# Altium schematic sheet 01_Power_Protection.SchDoc: POWER
size A4; SheetNumber: 2; SheetTotal: 12
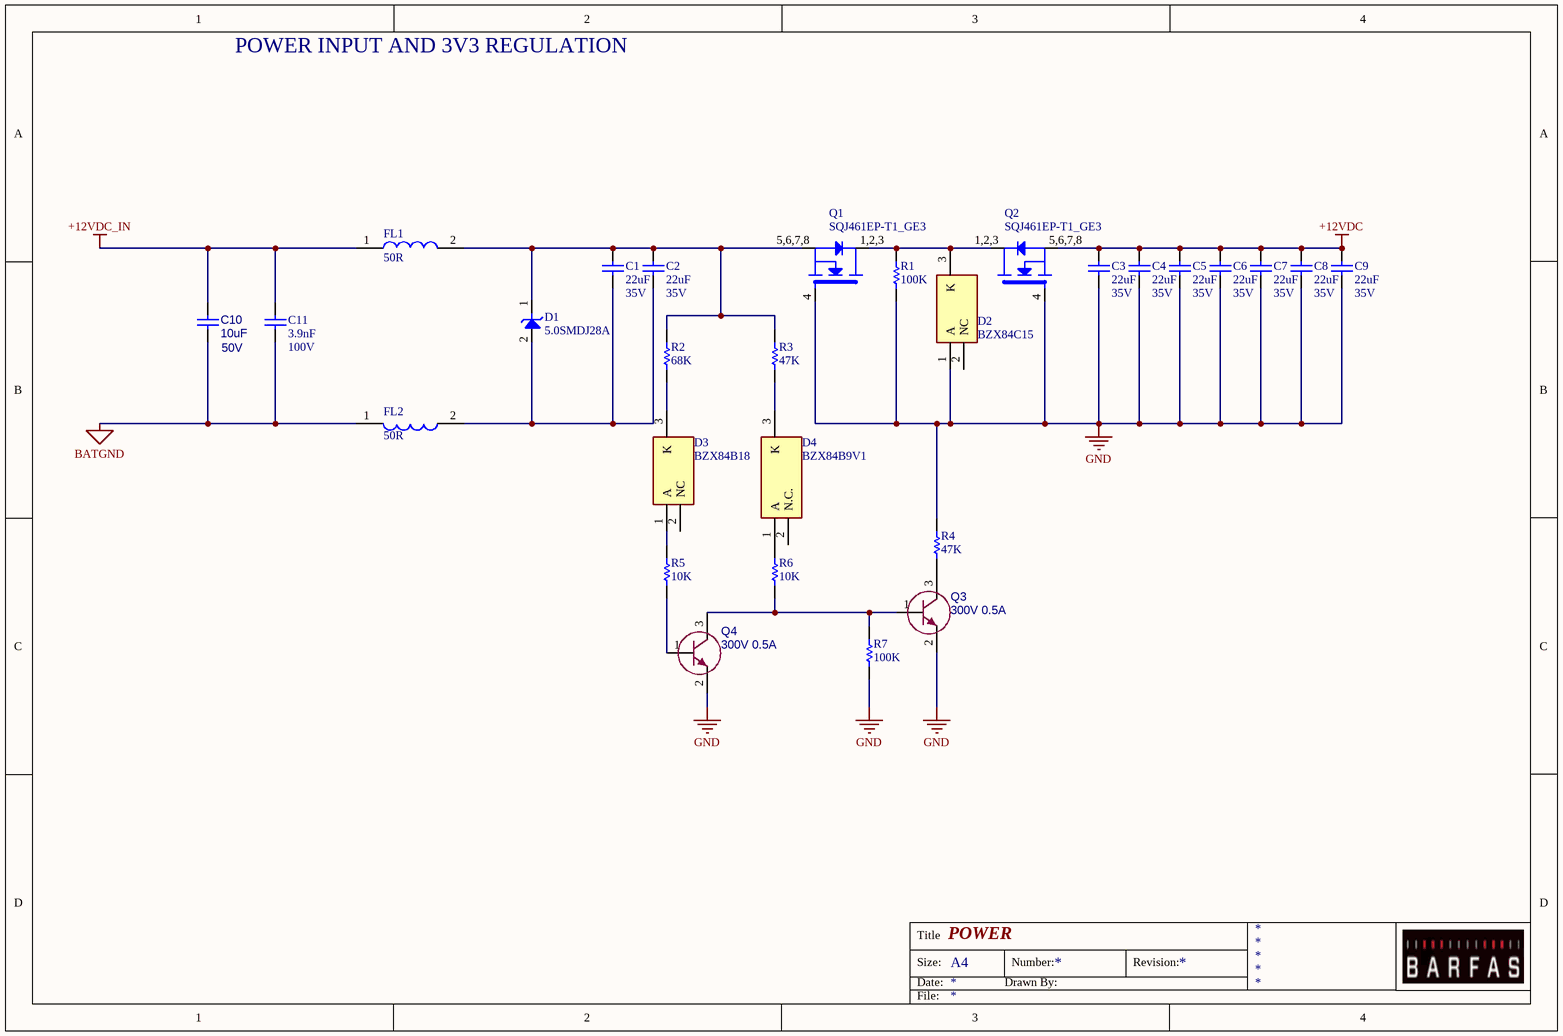
[diagram p0: 01_Power_Protection.SchDoc]

## Parts
C1  value 22uF  Voltage: 35V  [CAP_0805]  (hidden comment: GMC21X5R226M35NT)
C2  value 22uF  Voltage: 35V  [CAP_0805]  (hidden comment: GMC21X5R226M35NT)
C3  value 22uF  Voltage: 35V  [CAP_0805]  (hidden comment: GMC21X5R226M35NT)
C4  value 22uF  Voltage: 35V  [CAP_0805]  (hidden comment: GMC21X5R226M35NT)
C5  value 22uF  Voltage: 35V  [CAP_0805]  (hidden comment: GMC21X5R226M35NT)
C6  value 22uF  Voltage: 35V  [CAP_0805]  (hidden comment: GMC21X5R226M35NT)
C7  value 22uF  Voltage: 35V  [CAP_0805]  (hidden comment: GMC21X5R226M35NT)
C8  value 22uF  Voltage: 35V  [CAP_0805]  (hidden comment: GMC21X5R226M35NT)
C9  value 22uF  Voltage: 35V  [CAP_0805]  (hidden comment: GMC21X5R226M35NT)
C10  value 10uF  Voltage: 50V  [CAP_1206]  (hidden comment: CL31B106KBHNNNE)
C11  value 3.9nF  Voltage: 100V  [CAP_0603]  (hidden comment: AC0603KRX7R0BB392)
D1  5.0SMDJ28A  [SMCJ58A]
D2  BZX84C15  [SOT95P240X120-3N]
D3  BZX84B18  [SOT95P240X110-3N]
D4  BZX84B9V1  [SOT95P240X110-3N]
FL1  value 50R  [BLM31AJ601SH1K]  (hidden comment: BLM31SN500SZ1L)
FL2  value 50R  [BLM31AJ601SH1K]  (hidden comment: BLM31SN500SZ1L)
Q1  SQJ461EP-T1_GE3  [SOT323]
Q2  SQJ461EP-T1_GE3  [SOT323]
Q3  value 300V 0.5A  [SOT-23-3]  (hidden comment: MMBTA42_R1_00001)
Q4  value 300V 0.5A  [SOT-23-3]  (hidden comment: MMBTA42_R1_00001)
R1  value 100K  [RES_0402]  (hidden comment: 0402WGF1003TCE)
R2  value 68K  [RES_0402]  (hidden comment: 0402WGF6802TCE)
R3  value 47K  [RES_0603]  (hidden comment: 0603SAF4702T5E)
R4  value 47K  [RES_0603]  (hidden comment: 0603SAF4702T5E)
R5  value 10K  [RES_0402]  (hidden comment: RC0402JR-0710KL)
R6  value 10K  [RES_0402]  (hidden comment: RC0402JR-0710KL)
R7  value 100K  [RES_0402]  (hidden comment: 0402WGF1003TCE)

## Nets
+12VDC: C3.1 C4.1 C5.1 C6.1 C7.1 C8.1 C9.1 Q2.5,6,7,8(S)
+12VDC_IN: C10.1 C11.2 FL1.1
BATGND: C10.2 C11.1 FL2.1
GND: C3.2 C4.2 C5.2 C6.2 C7.2 C8.2 C9.2 D2.1(A) Q1.4(G) Q2.4(G) Q3.2(E) Q4.2(E) R1.1 R4.2 R7.1
NetC1_1: C1.1 C2.1 D1.1 FL1.2 Q1.5,6,7,8(S) R2.2 R3.2
NetC1_2: C1.2 C2.2 D1.2 FL2.2
NetD2_3: D2.3(K) Q1.1,2,3(D) Q2.1,2,3(D) R1.2
NetD3_1: D3.1(A) R5.2
NetD3_3: D3.3(K) R2.1
NetD4_1: D4.1(A) R6.2
NetD4_3: D4.3(K) R3.1
NetQ3_1: Q3.1(B) Q4.3(C) R6.1 R7.2
NetQ3_3: Q3.3(C) R4.1
NetQ4_1: Q4.1(B) R5.1

Not connected (* = marked no-connect by the designer): D2 2(NC); D3 2(NC); D4 2(N.C.)

## Notes on the sheet
- POWER INPUT AND 3V3 REGULATION
- Title
- Size:
- Date:
- A4
- Drawn By:
- Number:
- Revision:
- File:

## Library data of the parts
C1-C9 = C01758: 22 µF ±20% 35V Ceramic Capacitor X5R 0805 (2012 Metric); Manufacturer: Cal-Chip Electronics, Inc.; Manufacturer Part Number: GMC21X5R226M35NT
C10 = CL31A106KBHNNNE: MLCC (3216) 1206 10uF 50VDC ±10% X7R; Manufacturer: SAMSUNG; Package: 1206 (3216 Metric); Manufacturer Part Number: CL31B106KBHNNNE
C11 = C01763: MLCC (1608) 0603 3.9nF 100VDC ±10% X7R AEC-Q200; Manufacturer: YAGEO; Manufacturer Part Number: AC0603KRX7R0BB392
D1 = 5.0SMDJ28A: 45.4V Clamp 110A Ipp Tvs Diode Surface Mount DO-214AB (SMC); Manufacturer: Bourns Inc.; Datasheet Link: https://www.diodes.com/part/view/SMCJ58A; Height: 2.5mm; Manufacturer Part Number: 5.0SMDJ28A; Mouser Part Number: N/A; Mouser Price/Stock: https://www.mouser.co.uk/ProductDetail/Diodes-Incorporated/SMCJ58A?qs=evjyFmOIEsnFZCuxUMyzBg%3D%3D
D2 = BZX84C15: Zener Diode; Manufacturer: Diotec; Manufacturer Part Number: BZX84C15
D3 = BZX84B18: Zener Diode; Manufacturer: PANJIT; Manufacturer Part Number: BZX84B18
D4 = BZX84B9V1: Zener Diode; Manufacturer: PANJIT; Manufacturer Part Number: BZX84B9V1
FL1 FL2 = BLM31SN500SZ1L: Ferrite Bead, 50 ohm @ 100 MHz, 12 A, 1206; Manufacturer: Murata Electronics; Manufacturer Part Number: BLM31SN500SZ1L
Q1 Q2 = SQJ461EP-T1_GE3: P-Channel 60 V 30A (Tc) 83W (Tc) Surface Mount PowerPAK® SO-8; Manufacturer: Vishay Siliconix; Value: *; Supplier 1: OZDISAN; Manufacturer Part Number: SQJ461EP-T1_GE3
Q3 Q4 = MMBTA42_R1_00001: TRANSISTOR DIS.500mA 300V NPN SOT23 GEN. SMT; Manufacturer: PANJIT; Package: SOT23; Supplier Part Number 1: 3757-MMBTA42_R1_00001CT-ND; Supplier Part Number 2: *; Supplier Part Number 3: MMBTA42_R1_00001; Supplier 1: DIGIKEY; Supplier 2: MOUSER; Supplier 3: OZDISAN; Manufacturer Part Number: MMBTA42_R1_00001
R1 R7 = R03000: RES.(1005) 0402 100K Ohms 1% 1/16W 100PPM; Manufacturer: ROYALOHM; Manufacturer Part Number: 0402WGF1003TCE
R2 = R03000: RES.(1005) 0402 68K Ohms 1% 1/16W 100PPM; Manufacturer: ROYALOHM; Manufacturer Part Number: 0402WGF6802TCE
R3 R4 = 0603SAF4702T5E: RES.(1608) 0603 47K Ohms 1% 1/10W-S 100PPM; Manufacturer: ROYALOHM; Supplier 1: Ozdisan; Manufacturer Part Number: 0603SAF4702T5E
R5 R6 = R03000: RES.(1005) 0402 10K Ohms 5% 1/16W 100PPM SMT; Manufacturer: YAGEO; Manufacturer Part Number: RC0402JR-0710KL